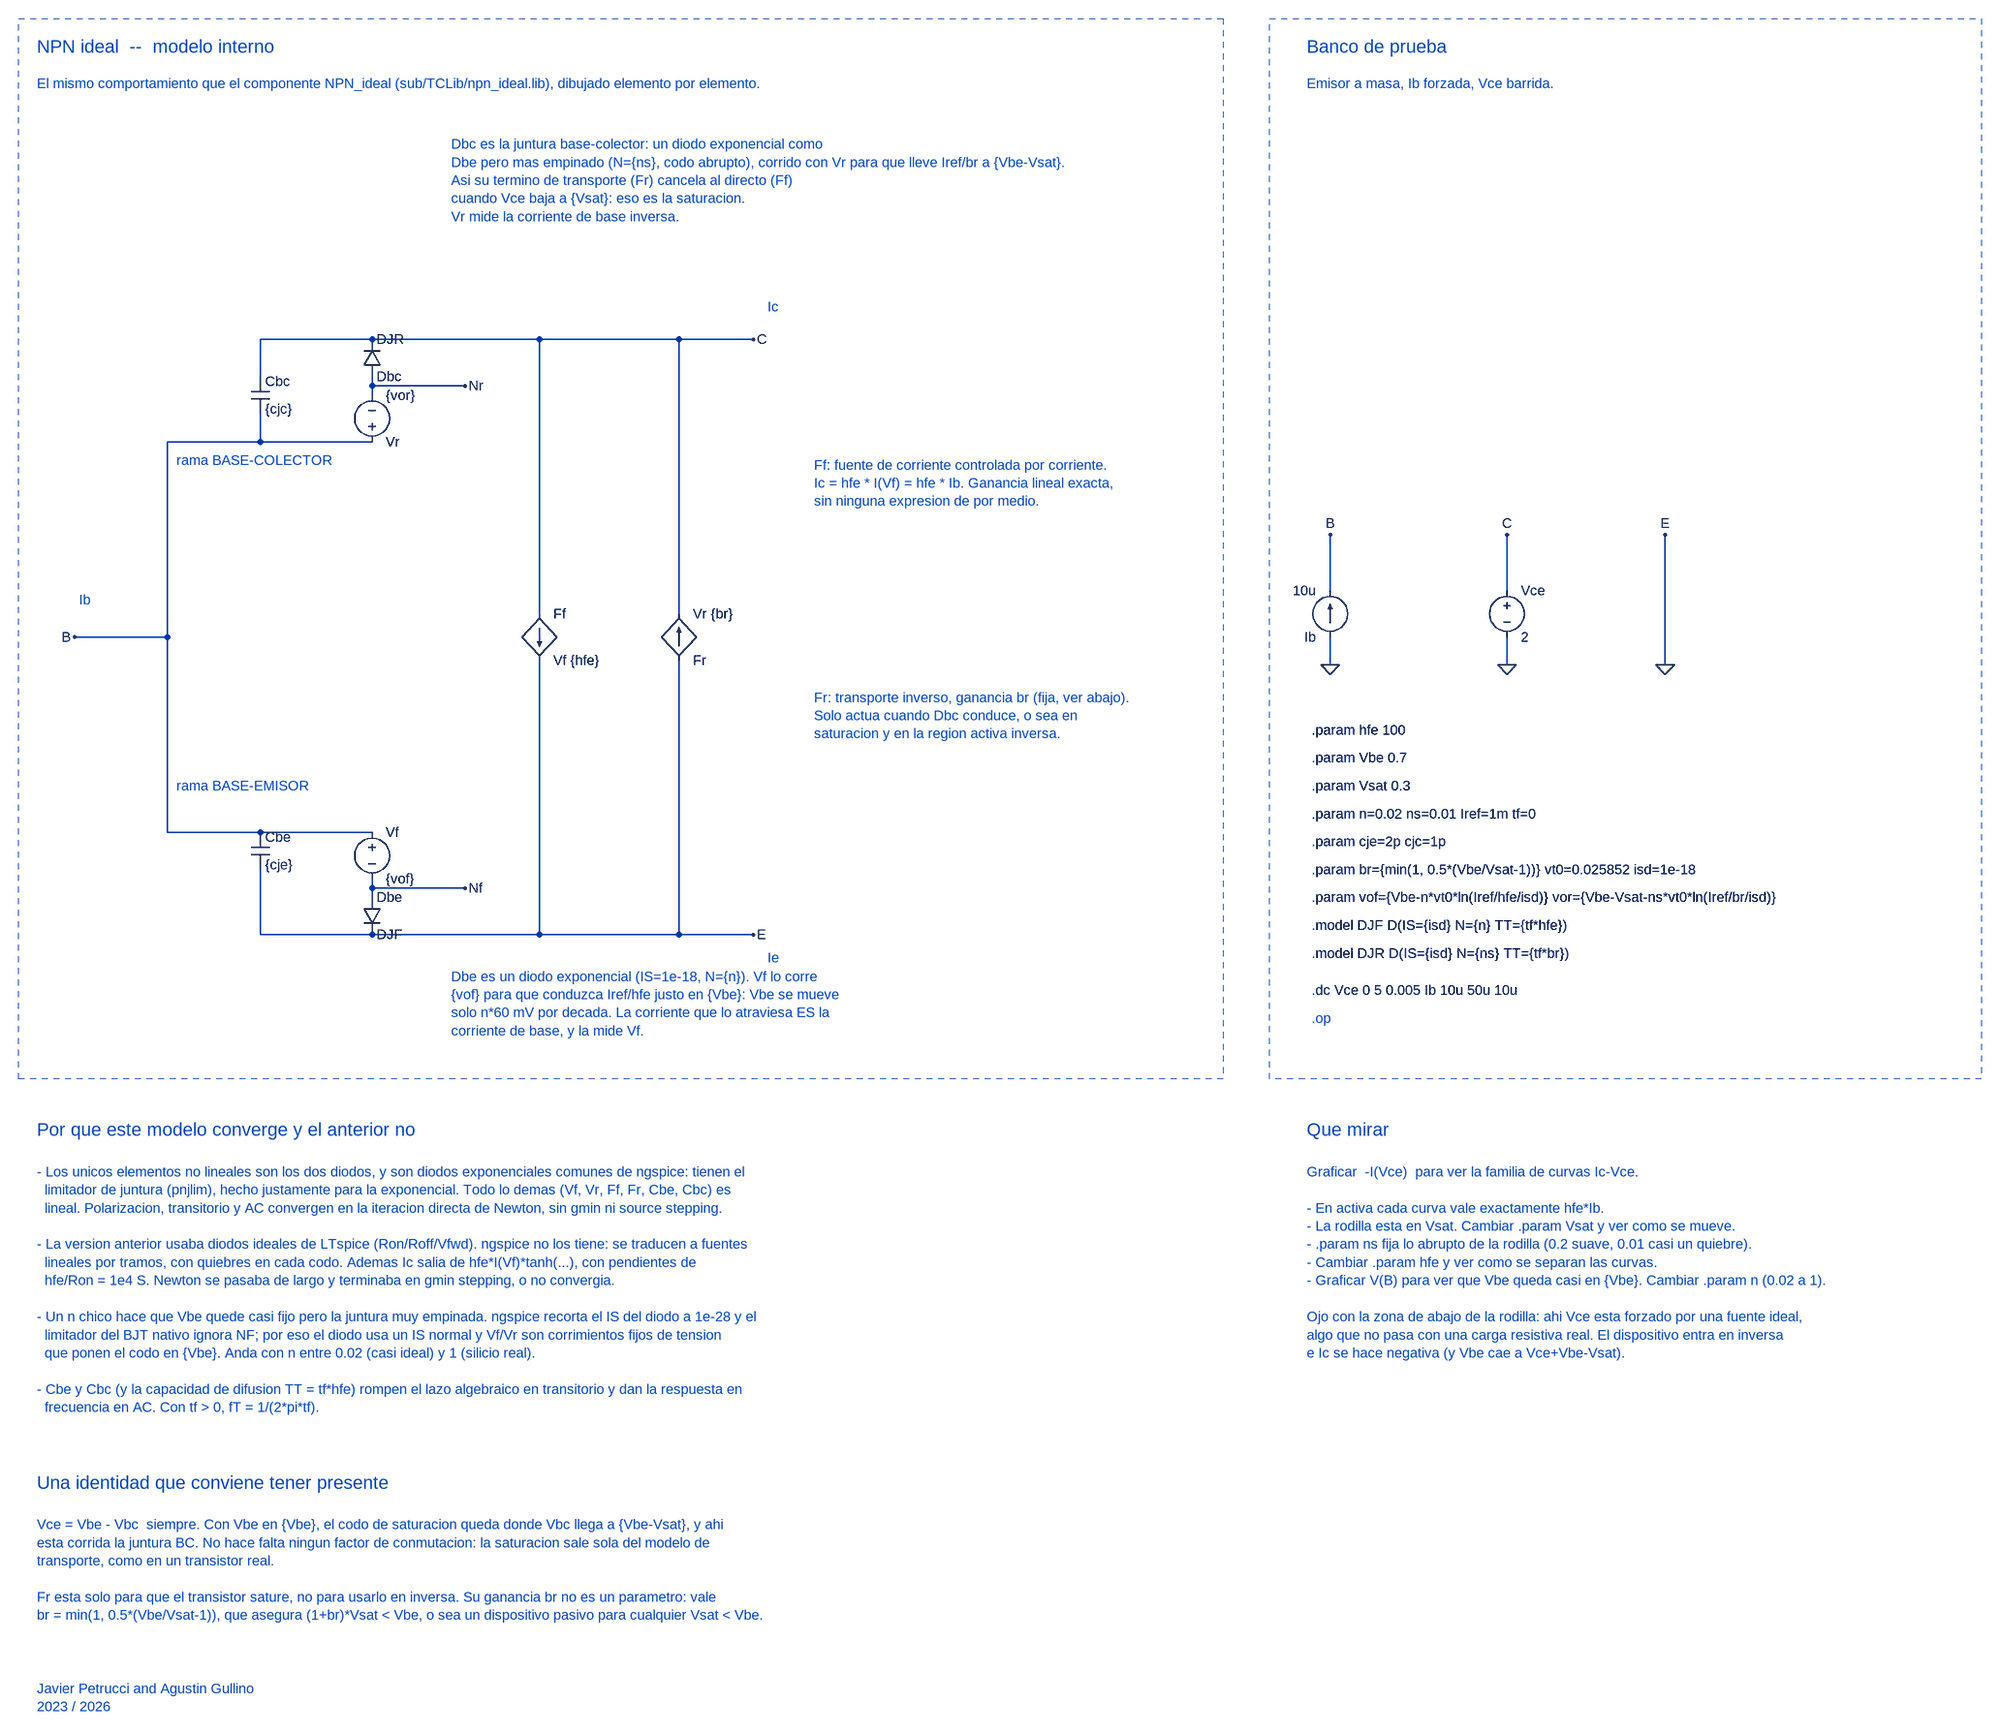
[diagram p0: schematic TC40b - BJT Ideal (modelo nuevo).asc]
TC40b - BJT Ideal (modelo nuevo).asc, the LTspice schematic file:
Version 4
SHEET 1 3200 2600
WIRE -160 -512 32 -512
WIRE 32 -512 320 -512
WIRE 320 -512 560 -512
WIRE 560 -512 688 -512
WIRE -160 512 32 512
WIRE 32 512 320 512
WIRE 320 512 560 512
WIRE 560 512 688 512
WIRE -320 -336 -160 -336
WIRE -160 -336 32 -336
WIRE -320 336 -160 336
WIRE -160 336 32 336
WIRE -320 -336 -320 0
WIRE -320 0 -320 336
WIRE -320 0 -480 0
WIRE 32 -416 32 -432
WIRE 32 -432 32 -448
WIRE 32 -432 192 -432
WIRE 32 416 32 432
WIRE 32 432 32 448
WIRE 32 432 192 432
WIRE 320 -512 320 -40
WIRE 320 40 320 512
WIRE 560 -512 560 -40
WIRE 560 40 560 512
WIRE -160 -512 -160 -448
WIRE -160 -384 -160 -336
WIRE -160 400 -160 512
WIRE 1680 -80 1680 -176
WIRE 1680 0 1680 48
WIRE 1984 -80 1984 -176
WIRE 1984 0 1984 48
WIRE 2256 -176 2256 48
FLAG -480 0 B
FLAG 688 -512 C
FLAG 688 512 E
FLAG 192 -432 Nr
FLAG 192 432 Nf
FLAG 1680 -176 B
FLAG 1680 48 0
FLAG 1984 -176 C
FLAG 1984 48 0
FLAG 2256 -176 E
FLAG 2256 48 0
SYMBOL voltage 32 -320 M180
WINDOW 123 0 0 Left 0
WINDOW 39 0 0 Left 0
SYMATTR InstName Vr
SYMATTR Value {vor}
SYMBOL diode 16 -448 M180
SYMATTR InstName Dbc
SYMATTR Value DJR
SYMBOL voltage 32 320 R0
WINDOW 123 0 0 Left 0
WINDOW 39 0 0 Left 0
SYMATTR InstName Vf
SYMATTR Value {vof}
SYMBOL diode 16 448 R0
SYMATTR InstName Dbe
SYMATTR Value DJF
SYMBOL f 320 -40 R0
SYMATTR InstName Ff
SYMATTR Value Vf {hfe}
SYMBOL f 560 40 M180
SYMATTR InstName Fr
SYMATTR Value Vr {br}
SYMBOL cap -176 -448 R0
SYMATTR InstName Cbc
SYMATTR Value {cjc}
SYMBOL cap -176 336 R0
SYMATTR InstName Cbe
SYMATTR Value {cje}
SYMBOL current 1680 0 R180
WINDOW 123 0 0 Left 0
WINDOW 39 0 0 Left 0
SYMATTR InstName Ib
SYMATTR Value 10u
SYMBOL voltage 1984 -96 R0
WINDOW 123 0 0 Left 0
WINDOW 39 0 0 Left 0
SYMATTR InstName Vce
SYMATTR Value 2
TEXT -544 -1016 Left 3 ;NPN ideal  --  modelo interno
TEXT -544 -952 Left 2 ;El mismo comportamiento que el componente NPN_ideal (sub/TCLib/npn_ideal.lib), dibujado elemento por elemento.
TEXT 168 -848 Left 2 ;Dbc es la juntura base-colector: un diodo exponencial como\nDbe pero mas empinado (N={ns}, codo abrupto), corrido con Vr para que lleve Iref/br a {Vbe-Vsat}.\nAsi su termino de transporte (Fr) cancela al directo (Ff)\ncuando Vce baja a {Vsat}: eso es la saturacion.\nVr mide la corriente de base inversa.
TEXT 168 584 Left 2 ;Dbe es un diodo exponencial (IS=1e-18, N={n}). Vf lo corre\n{vof} para que conduzca Iref/hfe justo en {Vbe}: Vbe se mueve\nsolo n*60 mV por decada. La corriente que lo atraviesa ES la\ncorriente de base, y la mide Vf.
TEXT 792 -296 Left 2 ;Ff: fuente de corriente controlada por corriente.\nIc = hfe * I(Vf) = hfe * Ib. Ganancia lineal exacta,\nsin ninguna expresion de por medio.
TEXT 792 104 Left 2 ;Fr: transporte inverso, ganancia br (fija, ver abajo).\nSolo actua cuando Dbc conduce, o sea en\nsaturacion y en la region activa inversa.
TEXT -304 -304 Left 2 ;rama BASE-COLECTOR
TEXT -304 256 Left 2 ;rama BASE-EMISOR
TEXT 712 -568 Left 2 ;Ic
TEXT 712 552 Left 2 ;Ie
TEXT -472 -64 Left 2 ;Ib
TEXT -544 848 Left 3 ;Por que este modelo converge y el anterior no
TEXT -544 920 Left 2 ;- Los unicos elementos no lineales son los dos diodos, y son diodos exponenciales comunes de ngspice: tienen el\n  limitador de juntura (pnjlim), hecho justamente para la exponencial. Todo lo demas (Vf, Vr, Ff, Fr, Cbe, Cbc) es\n  lineal. Polarizacion, transitorio y AC convergen en la iteracion directa de Newton, sin gmin ni source stepping.\n \n- La version anterior usaba diodos ideales de LTspice (Ron/Roff/Vfwd). ngspice no los tiene: se traducen a fuentes\n  lineales por tramos, con quiebres en cada codo. Ademas Ic salia de hfe*I(Vf)*tanh(...), con pendientes de\n  hfe/Ron = 1e4 S. Newton se pasaba de largo y terminaba en gmin stepping, o no convergia.\n \n- Un n chico hace que Vbe quede casi fijo pero la juntura muy empinada. ngspice recorta el IS del diodo a 1e-28 y el\n  limitador del BJT nativo ignora NF; por eso el diodo usa un IS normal y Vf/Vr son corrimientos fijos de tension\n  que ponen el codo en {Vbe}. Anda con n entre 0.02 (casi ideal) y 1 (silicio real).\n \n- Cbe y Cbc (y la capacidad de difusion TT = tf*hfe) rompen el lazo algebraico en transitorio y dan la respuesta en\n  frecuencia en AC. Con tf > 0, fT = 1/(2*pi*tf).
TEXT -544 1560 Left 3 ;Una identidad que conviene tener presente
TEXT -544 1632 Left 2 ;Vce = Vbe - Vbc  siempre. Con Vbe en {Vbe}, el codo de saturacion queda donde Vbc llega a {Vbe-Vsat}, y ahi\nesta corrida la juntura BC. No hace falta ningun factor de conmutacion: la saturacion sale sola del modelo de\ntransporte, como en un transistor real.\n \nFr esta solo para que el transistor sature, no para usarlo en inversa. Su ganancia br no es un parametro: vale\nbr = min(1, 0.5*(Vbe/Vsat-1)), que asegura (1+br)*Vsat < Vbe, o sea un dispositivo pasivo para cualquier Vsat < Vbe.
TEXT 1640 -1016 Left 3 ;Banco de prueba
TEXT 1640 -952 Left 2 ;Emisor a masa, Ib forzada, Vce barrida.
TEXT 1648 160 Left 2 !.param hfe 100
TEXT 1648 208 Left 2 !.param Vbe 0.7
TEXT 1648 256 Left 2 !.param Vsat 0.3
TEXT 1648 304 Left 2 !.param n=0.02 ns=0.01 Iref=1m tf=0
TEXT 1648 352 Left 2 !.param cje=2p cjc=1p
TEXT 1648 400 Left 2 !.param br={min(1, 0.5*(Vbe/Vsat-1))} vt0=0.025852 isd=1e-18
TEXT 1648 448 Left 2 !.param vof={Vbe-n*vt0*ln(Iref/hfe/isd)} vor={Vbe-Vsat-ns*vt0*ln(Iref/br/isd)}
TEXT 1648 496 Left 2 !.model DJF D(IS={isd} N={n} TT={tf*hfe})
TEXT 1648 544 Left 2 !.model DJR D(IS={isd} N={ns} TT={tf*br})
TEXT 1648 608 Left 2 !.dc Vce 0 5 0.005 Ib 10u 50u 10u
TEXT 1648 656 Left 2 ;.op
TEXT 1640 848 Left 3 ;Que mirar
TEXT 1640 920 Left 2 ;Graficar  -I(Vce)  para ver la familia de curvas Ic-Vce.\n \n- En activa cada curva vale exactamente hfe*Ib.\n- La rodilla esta en Vsat. Cambiar .param Vsat y ver como se mueve.\n- .param ns fija lo abrupto de la rodilla (0.2 suave, 0.01 casi un quiebre).\n- Cambiar .param hfe y ver como se separan las curvas.\n- Graficar V(B) para ver que Vbe queda casi en {Vbe}. Cambiar .param n (0.02 a 1).\n \nOjo con la zona de abajo de la rodilla: ahi Vce esta forzado por una fuente ideal,\nalgo que no pasa con una carga resistiva real. El dispositivo entra en inversa\ne Ic se hace negativa (y Vbe cae a Vce+Vbe-Vsat).
TEXT -544 2016 Left 2 ;Javier Petrucci and Agustin Gullino\n2023 / 2026
RECTANGLE Normal 1496 760 -576 -1064 2
RECTANGLE Normal 2800 760 1576 -1064 2

The netlist it stands for:
* TC40b - BJT Ideal (modelo nuevo).asc
Vr B Nr {vor}
Dbc Nr C DJR
Vf B Nf {vof}
Dbe Nf 0 DJF
Ff C 0 Vf {hfe}
Fr 0 C Vr {br}
Cbc C B {cjc}
Cbe B 0 {cje}
Ib 0 B 10u
Vce C 0 2
.model D D
.lib standard.dio
* NPN ideal  --  modelo interno
* El mismo comportamiento que el componente NPN_ideal (sub/TCLib/npn_ideal.lib), dibujado elemento por elemento.
* Dbc es la juntura base-colector: un diodo exponencial como
* Dbe pero mas empinado (N={ns}, codo abrupto), corrido con Vr para que lleve Iref/br a {Vbe-Vsat}.
* Asi su termino de transporte (Fr) cancela al directo (Ff)
* cuando Vce baja a {Vsat}: eso es la saturacion.
* Vr mide la corriente de base inversa.
* Dbe es un diodo exponencial (IS=1e-18, N={n}). Vf lo corre
* {vof} para que conduzca Iref/hfe justo en {Vbe}: Vbe se mueve
* solo n*60 mV por decada. La corriente que lo atraviesa ES la
* corriente de base, y la mide Vf.
* Ff: fuente de corriente controlada por corriente.
* Ic = hfe * I(Vf) = hfe * Ib. Ganancia lineal exacta,
* sin ninguna expresion de por medio.
* Fr: transporte inverso, ganancia br (fija, ver abajo).
* Solo actua cuando Dbc conduce, o sea en
* saturacion y en la region activa inversa.
* rama BASE-COLECTOR
* rama BASE-EMISOR
* Ic
* Ie
* Ib
* Por que este modelo converge y el anterior no
* - Los unicos elementos no lineales son los dos diodos, y son diodos exponenciales comunes de ngspice: tienen el
*   limitador de juntura (pnjlim), hecho justamente para la exponencial. Todo lo demas (Vf, Vr, Ff, Fr, Cbe, Cbc) es
*   lineal. Polarizacion, transitorio y AC convergen en la iteracion directa de Newton, sin gmin ni source stepping.
* - La version anterior usaba diodos ideales de LTspice (Ron/Roff/Vfwd). ngspice no los tiene: se traducen a fuentes
*   lineales por tramos, con quiebres en cada codo. Ademas Ic salia de hfe*I(Vf)*tanh(...), con pendientes de
*   hfe/Ron = 1e4 S. Newton se pasaba de largo y terminaba en gmin stepping, o no convergia.
* - Un n chico hace que Vbe quede casi fijo pero la juntura muy empinada. ngspice recorta el IS del diodo a 1e-28 y el
*   limitador del BJT nativo ignora NF; por eso el diodo usa un IS normal y Vf/Vr son corrimientos fijos de tension
*   que ponen el codo en {Vbe}. Anda con n entre 0.02 (casi ideal) y 1 (silicio real).
* - Cbe y Cbc (y la capacidad de difusion TT = tf*hfe) rompen el lazo algebraico en transitorio y dan la respuesta en
*   frecuencia en AC. Con tf > 0, fT = 1/(2*pi*tf).
* Una identidad que conviene tener presente
* Vce = Vbe - Vbc  siempre. Con Vbe en {Vbe}, el codo de saturacion queda donde Vbc llega a {Vbe-Vsat}, y ahi
* esta corrida la juntura BC. No hace falta ningun factor de conmutacion: la saturacion sale sola del modelo de
* transporte, como en un transistor real.
* Fr esta solo para que el transistor sature, no para usarlo en inversa. Su ganancia br no es un parametro: vale
* br = min(1, 0.5*(Vbe/Vsat-1)), que asegura (1+br)*Vsat < Vbe, o sea un dispositivo pasivo para cualquier Vsat < Vbe.
* Banco de prueba
* Emisor a masa, Ib forzada, Vce barrida.
.param hfe 100
.param Vbe 0.7
.param Vsat 0.3
.param n=0.02 ns=0.01 Iref=1m tf=0
.param cje=2p cjc=1p
.param br={min(1, 0.5*(Vbe/Vsat-1))} vt0=0.025852 isd=1e-18
.param vof={Vbe-n*vt0*ln(Iref/hfe/isd)} vor={Vbe-Vsat-ns*vt0*ln(Iref/br/isd)}
.model DJF D(IS={isd} N={n} TT={tf*hfe})
.model DJR D(IS={isd} N={ns} TT={tf*br})
.dc Vce 0 5 0.005 Ib 10u 50u 10u
* .op
* Que mirar
* Graficar  -I(Vce)  para ver la familia de curvas Ic-Vce.
* - En activa cada curva vale exactamente hfe*Ib.
* - La rodilla esta en Vsat. Cambiar .param Vsat y ver como se mueve.
* - .param ns fija lo abrupto de la rodilla (0.2 suave, 0.01 casi un quiebre).
* - Cambiar .param hfe y ver como se separan las curvas.
* - Graficar V(B) para ver que Vbe queda casi en {Vbe}. Cambiar .param n (0.02 a 1).
* Ojo con la zona de abajo de la rodilla: ahi Vce esta forzado por una fuente ideal,
* algo que no pasa con una carga resistiva real. El dispositivo entra en inversa
* e Ic se hace negativa (y Vbe cae a Vce+Vbe-Vsat).
* Javier Petrucci and Agustin Gullino
* 2023 / 2026
.backanno
.end